# Altium schematic sheet LED_PWR_CTRL_Section.SchDoc
size A4; DocumentNumber: 3; SheetNumber: 3; SheetTotal: 6
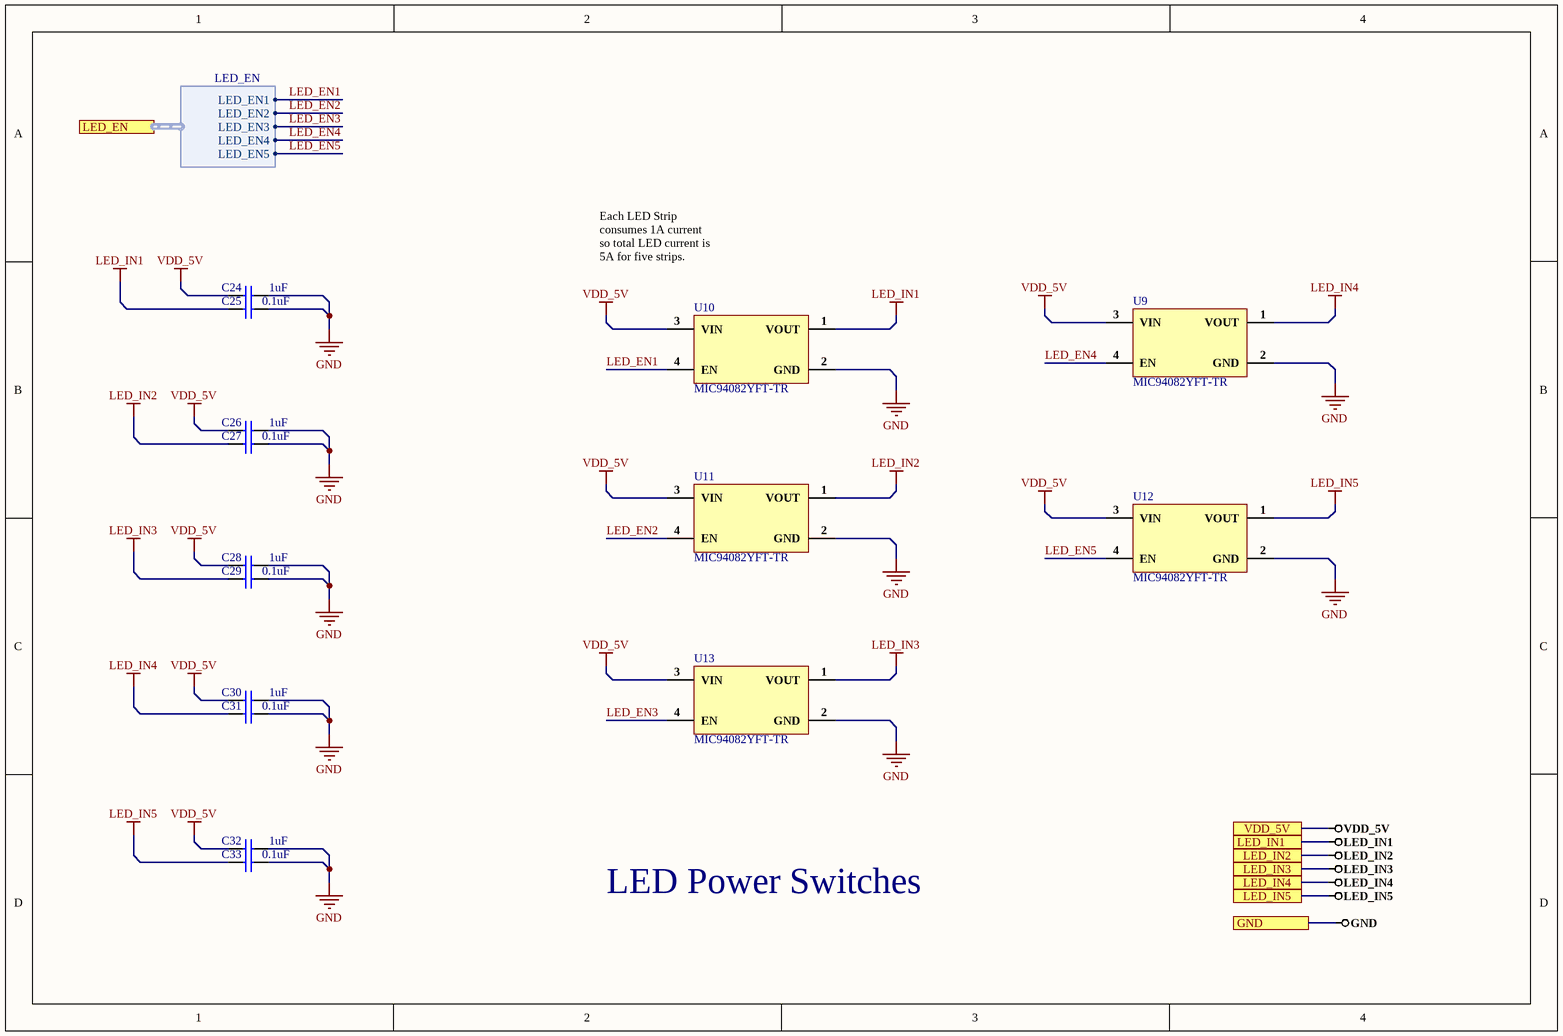
[diagram p0: LED_PWR_CTRL_Section.SchDoc]

## Parts
C24  1uF  [Cap0603]
C25  0.1uF  [Cap0603]
C26  1uF  [Cap0603]
C27  0.1uF  [Cap0603]
C28  1uF  [Cap0603]
C29  0.1uF  [Cap0603]
C30  1uF  [Cap0603]
C31  0.1uF  [Cap0603]
C32  1uF  [Cap0603]
C33  0.1uF  [Cap0603]
U9  MIC94082YFT-TR  [MIC94082YFT-TR]
U10  MIC94082YFT-TR  [MIC94082YFT-TR]
U11  MIC94082YFT-TR  [MIC94082YFT-TR]
U12  MIC94082YFT-TR  [MIC94082YFT-TR]
U13  MIC94082YFT-TR  [MIC94082YFT-TR]

## Ports
GND, LED_EN (harness LED_EN), LED_IN1, LED_IN2, LED_IN3, LED_IN4, LED_IN5, VDD_5V

## Harnesses
LED_EN: LED_EN1, LED_EN2, LED_EN3, LED_EN4, LED_EN5

## Nets
GND: C24.2 C25.2 C26.2 C27.2 C28.2 C29.2 C30.2 C31.2 C32.2 C33.2 U9.2(GND) U10.2(GND) U11.2(GND) U12.2(GND) U13.2(GND) ; port GND
LED_IN1: C25.1 U10.1(VOUT) ; port LED_IN1
LED_IN2: C27.1 U11.1(VOUT) ; port LED_IN2
LED_IN3: C29.1 U13.1(VOUT) ; port LED_IN3
LED_IN4: C31.1 U9.1(VOUT) ; port LED_IN4
LED_IN5: C33.1 U12.1(VOUT) ; port LED_IN5
VDD_5V: C24.1 C26.1 C28.1 C30.1 C32.1 U9.3(VIN) U10.3(VIN) U11.3(VIN) U12.3(VIN) U13.3(VIN) ; port VDD_5V
LED_EN1: U10.4(EN) ; port LED_EN.LED_EN1
LED_EN2: U11.4(EN) ; port LED_EN.LED_EN2
LED_EN3: U13.4(EN) ; port LED_EN.LED_EN3
LED_EN4: U9.4(EN) ; port LED_EN.LED_EN4
LED_EN5: U12.4(EN) ; port LED_EN.LED_EN5

## Notes on the sheet
- Each LED Strip consumes 1A current so total LED current is 5A for five strips.
- LED Power Switches

## Library data of the parts
C24 C26 C28 C30 C32 = CC0603KRX5R8BB105: CAP CER 1UF 25V X5R 0603; Manufacturer: Yageo; Tolerance: 10%; Supplier 1: Digi-Key; Manufacturer Part Number: CC0603KRX5R8BB105; Stock 1: 277068; Pricing 1: 1=0.13, 10=0.093, 100=0.0437, 500=0.03066, 1000=0.02539 (USD); Mount: Surface Mount; Case/Package: 0603; Number of Pins: 2; Case Code (Metric): 1608; Case Code (Imperial): 0603; Min Operating Temperature: -55°C; Max Operating Temperature: 85°C; Capacitance: 1uF; Dielectric: X5R; Package Quantity: 1; Voltage Rating: 25V; Packaging: Tape and Reel; Termination: SMD/SMT; Voltage Rating (DC): 25V; Length: 1.6mm; Height: 0.8mm; Width: 0.031inch; Thickness: 0.035inch; Depth: 0.8mm; Radiation Hardening: No; REACH SVHC: No SVHC; Lead Free: Lead Free; Halogen Free: Halogen Free; ComponentLink1URL: http://www.yageo.com/documents/recent/UPY-GPHC_X5R_4V-to-50V_25.pdf?src-supplier=Digi-Key; ComponentLink1Description: http://www.yageo.com/documents/recent/UPY-GPHC_X5R_4V-to-50V_25.pdf?src-supplier=Digi-Key; ComponentLink2URL: http://www.yageo.com/documents/recent/UPY-GPHC_X5R_4V-to-50V_12.pdf?src-supplier=Avnet+Europe; ComponentLink2Description: http://www.yageo.com/documents/recent/UPY-GPHC_X5R_4V-to-50V_12.pdf?src-supplier=Avnet+Europe; ComponentLink3URL: http://www.farnell.com/datasheets/1525783.pdf?src-supplier=Element14; ComponentLink3Description: http://www.farnell.com/datasheets/1525783.pdf?src-supplier=Element14; ComponentLink4URL: http://www.yageo.com/documents/recent/UPY-GPHC_X5R_4V-to-50V_12.pdf?src-supplier=Avnet; ComponentLink4Description: http://www.yageo.com/documents/recent/UPY-GPHC_X5R_4V-to-50V_12.pdf?src-supplier=Avnet; Supplier Part Number 1: 311-1445-6-ND
C25 C27 C29 C31 C33 = CC0603KRX7R0BB104: CAP CER 0.1UF 100V X7R 0603; Manufacturer: Yageo; Capacitance: 100nF; Tolerance: 10%; Supplier 1: Digi-Key; Manufacturer Part Number: CC0603KRX7R0BB104; RoHS: Yes; Category: Ceramic Capacitors; Stock 1: 60476; Pricing 1: 1=0.19000, 10=0.13500, 50=0.07680, 100=0.06370, 500=0.04466, 1000=0.03696 (USD); Mount: Surface Mount; Case/Package: 0603; Case Code (Metric): 1608; Case Code (Imperial): 0603; Weight: 7.1E-05oz; Min Operating Temperature: -55°C; Max Operating Temperature: 125°C; Package Quantity: 4000; Voltage Rating: 100V; Packaging: Tape and Reel; Dielectric: X7R; Termination: SMD/SMT; Resistor Type: Ceramic; Voltage Rating (DC): 100V; Series: CC; Length: 0.063inch; Width: 0.031inch; Thickness: 0.035inch; Depth: 0.8mm; Lead Free: Lead Free; RoHS Compliant: Yes; ComponentLink1URL: https://datasheet.ciiva.com/6277/mlccorderingcode-6277030.pdf?src-supplier=Digi-Key; ComponentLink1Description: https://datasheet.ciiva.com/6277/mlccorderingcode-6277030.pdf?src-supplier=Digi-Key; ComponentLink2URL: https://datasheet.ciiva.com/6277/mlccorderingcode-6277081.pdf?src-supplier=Digi-Key; ComponentLink2Description: https://datasheet.ciiva.com/6277/mlccorderingcode-6277081.pdf?src-supplier=Digi-Key; ComponentLink3URL: https://datasheet.ciiva.com/6277/mlccorderingcode-6277082.pdf?src-supplier=Digi-Key; ComponentLink3Description: https://datasheet.ciiva.com/6277/mlccorderingcode-6277082.pdf?src-supplier=Digi-Key; Supplier Part Number 1: 311-1523-1-ND
U9-U13 = MIC94082YFT-TR: Power Switch Hi Side 2A 4-Pin Thin MLF T/R; Manufacturer: Microchip; Manufacturer Part Number: MIC94082YFTTR; Number of Outputs: 1; Min Supply Voltage: 1.7V; Max Supply Voltage: 5.5V; Interface: On/Off; Turn-Off Delay Time: 200ns; On-State Resistance: 67mR; Turn-On Delay Time: 1.5us; Output Configuration: High Side; Supplier 1: Digi-Key; RoHS: Yes; Category: Hot Swap Controllers; Mount: Surface Mount; Number of Pins: 4; Min Operating Temperature: -40°C; Max Operating Temperature: 125°C; Nominal Supply Current: 2A; Output Current: 2A; Packaging: Tape and Reel; Package Quantity: 5000; Current Rating: 2A; Max Output Current: 2A; Series: -; Supply Current: 2A; Rated Current-Max: 2A; On-state Resistance-Max: 67MR; Radiation Hardening: No; REACH SVHC: No SVHC; Lead Free: Lead Free; RoHS Compliant: Yes; ComponentLink1URL: https://datasheet.ciiva.com/1955/mic94080-5-1955731.pdf?src-supplier=Digi-Key; ComponentLink1Description: https://datasheet.ciiva.com/1955/mic94080-5-1955731.pdf?src-supplier=Digi-Key; ComponentLink2URL: https://datasheet.ciiva.com/1955/mic94080-5-1955730.pdf?src-supplier=Digi-Key; ComponentLink2Description: https://datasheet.ciiva.com/1955/mic94080-5-1955730.pdf?src-supplier=Digi-Key; ComponentLink3URL: https://datasheet.ciiva.com/1955/mic94080-5-1955732.pdf?src-supplier=Digi-Key; ComponentLink3Description: https://datasheet.ciiva.com/1955/mic94080-5-1955732.pdf?src-supplier=Digi-Key; ComponentLink4URL: https://datasheet.ciiva.com/16466/mic94080-5-16466430.pdf?src-supplier=Future+Electronics; ComponentLink4Description: https://datasheet.ciiva.com/16466/mic94080-5-16466430.pdf?src-supplier=Future+Electronics; ComponentLink5URL: https://datasheet.ciiva.com/26948/getdatasheetpartid-792432-26948156.pdf?src-supplier=Verical; ComponentLink5Description: https://datasheet.ciiva.com/26948/getdatasheetpartid-792432-26948156.pdf?src-supplier=Verical; Supplier Part Number 1: 576-3342-1-ND